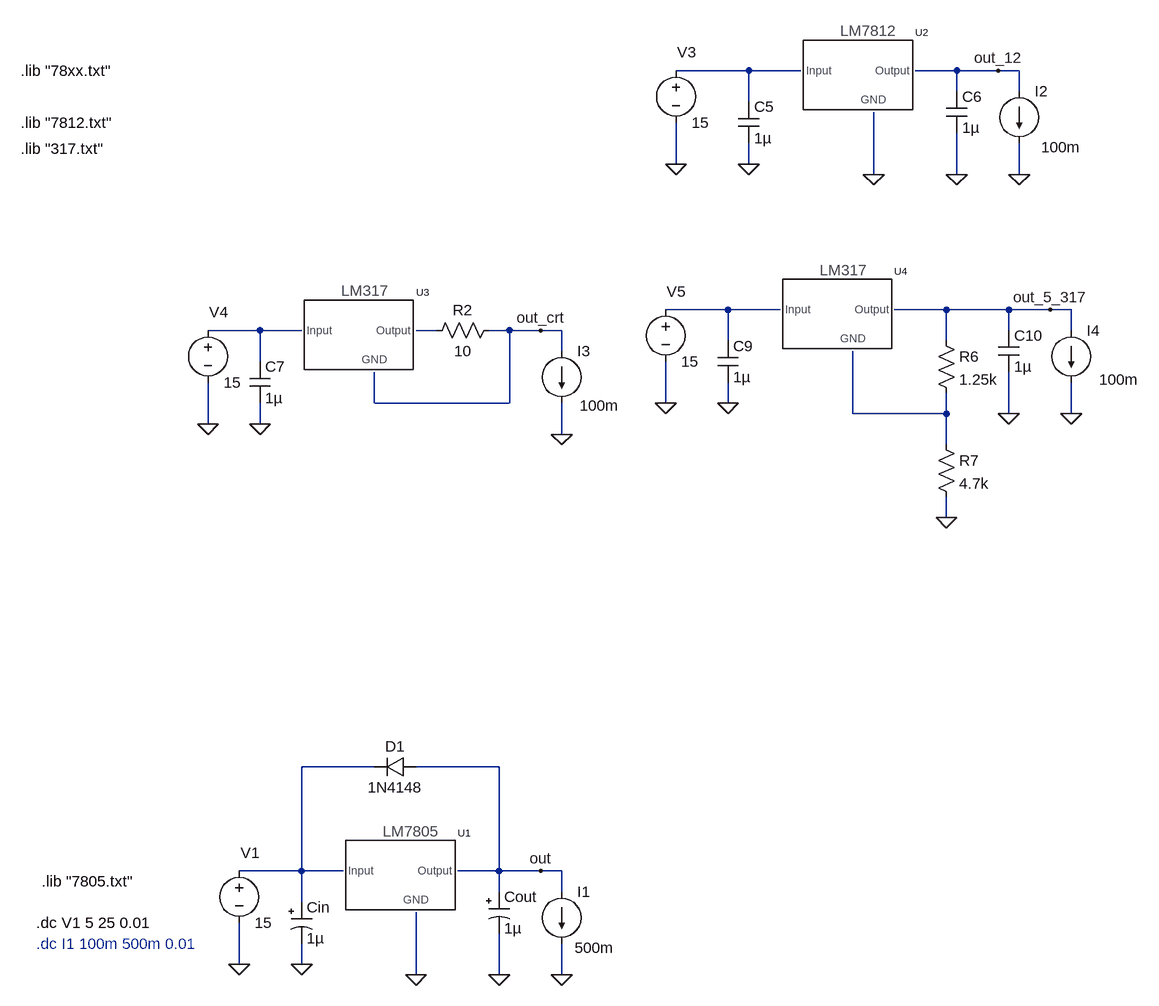
[diagram p0: schematic LM7805.asc]
LM7805.asc, the LTspice schematic file:
Version 4
SHEET 1 1928 3252
WIRE 992 96 880 96
WIRE 1072 96 992 96
WIRE 1312 96 1248 96
WIRE 1376 96 1312 96
WIRE 1408 96 1376 96
WIRE 1312 128 1312 96
WIRE 1408 128 1408 96
WIRE 992 144 992 96
WIRE 880 240 880 176
WIRE 992 240 992 208
WIRE 1184 256 1184 160
WIRE 1312 256 1312 192
WIRE 1408 256 1408 208
WIRE 960 464 864 464
WIRE 1040 464 960 464
WIRE 1296 464 1216 464
WIRE 1392 464 1296 464
WIRE 1456 464 1392 464
WIRE 1488 464 1456 464
WIRE 240 496 160 496
WIRE 304 496 240 496
WIRE 512 496 480 496
WIRE 624 496 592 496
WIRE 672 496 624 496
WIRE 704 496 672 496
WIRE 1392 496 1392 464
WIRE 1488 496 1488 464
WIRE 960 512 960 464
WIRE 1296 512 1296 464
WIRE 704 528 704 496
WIRE 240 544 240 496
WIRE 416 608 416 560
WIRE 624 608 624 496
WIRE 624 608 416 608
WIRE 864 608 864 544
WIRE 960 608 960 576
WIRE 1152 624 1152 528
WIRE 1296 624 1296 592
WIRE 1296 624 1152 624
WIRE 1392 624 1392 560
WIRE 1488 624 1488 576
WIRE 160 640 160 576
WIRE 240 640 240 608
WIRE 704 656 704 608
WIRE 1296 672 1296 624
WIRE 1296 784 1296 752
WIRE 416 1168 304 1168
WIRE 608 1168 480 1168
WIRE 304 1328 304 1168
WIRE 304 1328 208 1328
WIRE 368 1328 304 1328
WIRE 608 1328 608 1168
WIRE 608 1328 544 1328
WIRE 672 1328 608 1328
WIRE 704 1328 672 1328
WIRE 608 1360 608 1328
WIRE 704 1360 704 1328
WIRE 304 1376 304 1328
WIRE 208 1472 208 1408
WIRE 304 1472 304 1440
WIRE 480 1488 480 1392
WIRE 608 1488 608 1424
WIRE 704 1488 704 1440
FLAG 480 1488 0
FLAG 704 1488 0
FLAG 208 1472 0
FLAG 304 1472 0
FLAG 608 1488 0
FLAG 672 1328 out
FLAG 1184 256 0
FLAG 1408 256 0
FLAG 880 240 0
FLAG 992 240 0
FLAG 1312 256 0
FLAG 1376 96 out_12
FLAG 704 656 0
FLAG 160 640 0
FLAG 240 640 0
FLAG 672 496 out_crt
FLAG 1296 784 0
FLAG 1488 624 0
FLAG 864 608 0
FLAG 960 608 0
FLAG 1392 624 0
FLAG 1456 464 out_5_317
SYMBOL polcap 592 1360 R0
WINDOW 3 24 56 Left 2
SYMATTR Value 1µ
SYMATTR InstName Cout
SYMATTR Description Capacitor
SYMATTR Type cap
SYMATTR SpiceLine V=50 Irms=55m Rser=2.53014 Lser=1.66206n mfg="Würth Elektronik" pn="865080640001 WCAP-ASLI 4x5,5" type="Al electrolytic"
SYMBOL voltage 208 1312 R0
WINDOW 123 0 0 Left 2
WINDOW 39 0 0 Left 2
WINDOW 0 2 -12 Left 2
SYMATTR InstName V1
SYMATTR Value 15
SYMBOL LM7805 448 1296 R0
SYMATTR InstName U1
SYMATTR Prefix X
SYMATTR Value LM7805C
SYMBOL cap 976 144 R0
SYMATTR InstName C5
SYMATTR Value 1µ
SYMBOL cap 1296 128 R0
SYMATTR InstName C6
SYMATTR Value 1µ
SYMBOL voltage 880 80 R0
WINDOW 123 0 0 Left 2
WINDOW 39 0 0 Left 2
WINDOW 0 2 -12 Left 2
SYMATTR InstName V3
SYMATTR Value 15
SYMBOL cap 224 544 R0
SYMATTR InstName C7
SYMATTR Value 1µ
SYMBOL voltage 160 480 R0
WINDOW 123 0 0 Left 2
WINDOW 39 0 0 Left 2
WINDOW 0 2 -12 Left 2
SYMATTR InstName V4
SYMATTR Value 15
SYMBOL cap 944 512 R0
SYMATTR InstName C9
SYMATTR Value 1µ
SYMBOL cap 1376 496 R0
SYMATTR InstName C10
SYMATTR Value 1µ
SYMBOL voltage 864 448 R0
WINDOW 123 0 0 Left 2
WINDOW 39 0 0 Left 2
WINDOW 0 2 -12 Left 2
SYMATTR InstName V5
SYMATTR Value 15
SYMBOL LM317 384 464 R0
SYMATTR InstName U3
SYMATTR Prefix X
SYMATTR Value LM317
SYMBOL LM7812 1152 64 R0
SYMATTR InstName U2
SYMATTR Prefix X
SYMATTR Value LM7812C
SYMBOL res 608 480 R90
WINDOW 0 0 56 VBottom 2
WINDOW 3 32 56 VTop 2
SYMATTR InstName R2
SYMATTR Value 10
SYMBOL res 1280 496 R0
SYMATTR InstName R6
SYMATTR Value 1.25k
SYMBOL res 1280 656 R0
SYMATTR InstName R7
SYMATTR Value 4.7k
SYMBOL LM317 1120 432 R0
SYMATTR InstName U4
SYMATTR Prefix X
SYMATTR Value LM317
SYMBOL current 704 1360 R0
WINDOW 123 0 0 Left 0
WINDOW 39 0 0 Left 0
WINDOW 3 20 86 Left 2
SYMATTR Value 500m
SYMATTR InstName I1
SYMBOL current 1408 128 R0
WINDOW 3 34 86 Left 2
SYMATTR Value 100m
SYMATTR InstName I2
SYMBOL current 704 528 R0
WINDOW 3 28 84 Left 2
SYMATTR Value 100m
SYMATTR InstName I3
SYMBOL current 1488 496 R0
WINDOW 3 43 76 Left 2
WINDOW 123 0 0 Left 0
WINDOW 39 0 0 Left 0
SYMATTR Value 100m
SYMATTR InstName I4
SYMBOL diode 480 1152 R90
WINDOW 0 0 32 VBottom 2
WINDOW 3 32 32 VTop 2
SYMATTR InstName D1
SYMATTR Value 1N4148
SYMBOL polcap 288 1376 R0
SYMATTR InstName Cin
SYMATTR Value 1µ
TEXT -104 1408 Left 2 !.dc V1 5 25 0.01
TEXT -96 1344 Left 2 !.lib "7805.txt"
TEXT -128 96 Left 2 !.lib "78xx.txt"
TEXT -128 176 Left 2 !.lib "7812.txt"
TEXT -128 216 Left 2 !.lib "317.txt"
TEXT -104 1440 Left 2 ;.dc I1 100m 500m 0.01

The netlist it stands for:
* LM7805.asc
Cout out 0 1µ V=50 Irms=55m Rser=2.53014 Lser=1.66206n mfg="Würth Elektronik" pn="865080640001 WCAP-ASLI 4x5,5" type="Al electrolytic"
V1 N006 0 15
XU1 N006 0 out LM7805 params: LM7805C  ; pins Input GND Output
C5 N001 0 1µ
C6 out_12 0 1µ
V3 N001 0 15
C7 N003 0 1µ
V4 N003 0 15
C9 N002 0 1µ
C10 out_5_317 0 1µ
V5 N002 0 15
XU3 N003 out_crt N004 LM317 params: LM317  ; pins Input GND Output
XU2 N001 0 out_12 LM7812 params: LM7812C  ; pins Input GND Output
R2 out_crt N004 10
R6 out_5_317 N005 1.25k
R7 N005 0 4.7k
XU4 N002 N005 out_5_317 LM317 params: LM317  ; pins Input GND Output
I1 out 0 500m
I2 out_12 0 100m
I3 out_crt 0 100m
I4 out_5_317 0 100m
D1 out N006 1N4148
Cin N006 0 1µ
.model D D
.lib standard.dio
.dc V1 5 25 0.01
.lib "7805.txt"
.lib "78xx.txt"
.lib "7812.txt"
.lib "317.txt"
* .dc I1 100m 500m 0.01
.backanno
.end